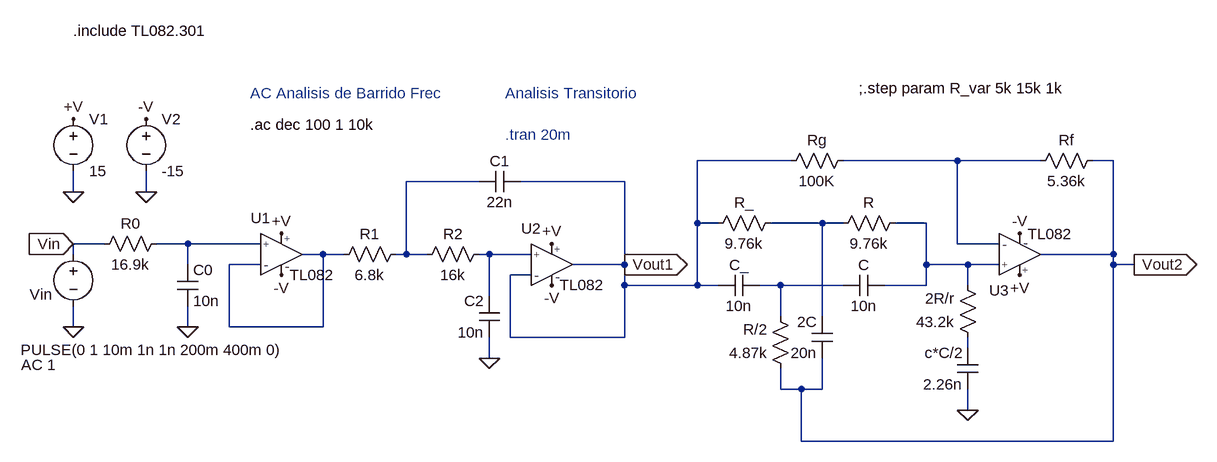
[diagram p0: schematic PasaBajos_Bessel_Fabricante_TL082_Eculizador_2doOrden_ValComerciales.asc]
PasaBajos_Bessel_Fabricante_TL082_Eculizador_2doOrden_ValComerciales.asc, the LTspice schematic file:
Version 4.1
SHEET 1 1584 680
WIRE 928 16 784 16
WIRE 1184 16 1008 16
WIRE 1312 16 1184 16
WIRE 1424 16 1392 16
WIRE 448 48 336 48
WIRE 672 48 512 48
WIRE -176 64 -176 32
WIRE -64 64 -64 32
WIRE 784 112 784 16
WIRE 816 112 784 112
WIRE 976 112 896 112
WIRE 1008 112 976 112
WIRE 1136 112 1088 112
WIRE -128 144 -176 144
WIRE 0 144 -48 144
WIRE 112 144 0 144
WIRE 1184 144 1184 16
WIRE 1248 144 1184 144
WIRE -176 160 -176 144
WIRE 208 160 176 160
WIRE 240 160 208 160
WIRE 336 160 336 48
WIRE 336 160 320 160
WIRE 368 160 336 160
WIRE 464 160 448 160
WIRE 528 160 464 160
WIRE 1424 160 1424 16
WIRE 1424 160 1312 160
WIRE 0 176 0 144
WIRE 112 176 64 176
WIRE 672 176 672 48
WIRE 672 176 592 176
WIRE 1136 176 1136 112
WIRE 1200 176 1136 176
WIRE 1248 176 1200 176
WIRE 1424 176 1424 160
WIRE 1456 176 1424 176
WIRE 528 192 496 192
WIRE 672 208 672 176
WIRE 784 208 784 112
WIRE 784 208 672 208
WIRE 816 208 784 208
WIRE 912 208 880 208
WIRE 1008 208 912 208
WIRE 1136 208 1136 176
WIRE 1136 208 1072 208
WIRE 1200 208 1200 176
WIRE 464 224 464 160
WIRE 912 256 912 208
WIRE 976 256 976 112
WIRE -176 272 -176 240
WIRE 0 272 0 240
WIRE 64 272 64 176
WIRE 208 272 208 160
WIRE 208 272 64 272
WIRE 496 288 496 192
WIRE 672 288 672 208
WIRE 672 288 496 288
WIRE 1200 304 1200 288
WIRE 464 320 464 288
WIRE 912 368 912 336
WIRE 944 368 912 368
WIRE 976 368 976 320
WIRE 976 368 944 368
WIRE 1200 400 1200 368
WIRE 944 448 944 368
WIRE 1424 448 1424 176
WIRE 1424 448 944 448
FLAG -176 64 0
FLAG -64 64 0
FLAG -176 -48 +V
FLAG 144 128 +V
FLAG 560 144 +V
FLAG -64 -48 -V
FLAG 144 192 -V
FLAG 560 208 -V
FLAG 0 272 0
FLAG 464 320 0
FLAG 672 176 Vout1
IOPIN 672 176 Out
FLAG -176 272 0
FLAG -176 144 Vin
IOPIN -176 144 In
FLAG 1280 192 +V
FLAG 1280 128 -V
FLAG 1200 400 0
FLAG 1456 176 Vout2
IOPIN 1456 176 Out
SYMBOL voltage -176 -64 R0
WINDOW 123 0 0 Left 0
WINDOW 39 0 0 Left 0
SYMATTR InstName V1
SYMATTR Value 15
SYMBOL voltage -64 -64 R0
WINDOW 123 0 0 Left 0
WINDOW 39 0 0 Left 0
SYMATTR InstName V2
SYMATTR Value -15
SYMBOL res -32 128 R90
WINDOW 0 0 56 VBottom 2
WINDOW 3 32 56 VTop 2
SYMATTR InstName R0
SYMATTR Value 16.9k
SYMBOL cap -16 176 R0
SYMATTR InstName C0
SYMATTR Value 10n
SYMBOL res 336 144 R90
WINDOW 0 0 56 VBottom 2
WINDOW 3 32 56 VTop 2
SYMATTR InstName R1
SYMATTR Value 6.8k
SYMBOL res 464 144 R90
WINDOW 0 0 56 VBottom 2
WINDOW 3 32 56 VTop 2
SYMATTR InstName R2
SYMATTR Value 16k
SYMBOL cap 512 32 R90
WINDOW 0 0 32 VBottom 2
WINDOW 3 32 32 VTop 2
SYMATTR InstName C1
SYMATTR Value 22n
SYMBOL cap 480 288 R180
WINDOW 0 24 56 Left 2
WINDOW 3 24 8 Left 2
SYMATTR InstName C2
SYMATTR Value 10n
SYMBOL voltage -176 144 R0
WINDOW 3 -81 163 Left 2
WINDOW 123 -80 186 Left 2
WINDOW 39 0 0 Left 0
WINDOW 0 -67 78 Left 2
SYMATTR Value PULSE(0 1 10m 1n 1n 200m 400m 0)
SYMATTR Value2 AC 1
SYMATTR InstName Vin
SYMBOL TL082 80 208 R0
SYMATTR InstName U1
SYMBOL TL082 496 224 R0
SYMATTR InstName U2
SYMBOL TL082 1216 112 M180
SYMATTR InstName U3
SYMBOL res 1024 0 R90
WINDOW 0 0 56 VBottom 2
WINDOW 3 32 56 VTop 2
SYMATTR InstName Rg
SYMATTR Value 100K
SYMBOL res 912 96 R90
WINDOW 0 0 56 VBottom 2
WINDOW 3 32 56 VTop 2
SYMATTR InstName R_
SYMATTR Value 9.76k
SYMBOL cap 880 192 R90
WINDOW 0 0 32 VBottom 2
WINDOW 3 32 32 VTop 2
SYMATTR InstName C_
SYMATTR Value 10n
SYMBOL res 1296 32 R270
WINDOW 0 32 56 VTop 2
WINDOW 3 0 56 VBottom 2
SYMATTR InstName Rf
SYMATTR Value 5.36k
SYMBOL res 1104 96 R90
WINDOW 0 0 56 VBottom 2
WINDOW 3 32 56 VTop 2
SYMATTR InstName R
SYMATTR Value 9.76k
SYMBOL cap 1072 192 R90
WINDOW 0 0 32 VBottom 2
WINDOW 3 32 32 VTop 2
SYMATTR InstName C
SYMATTR Value 10n
SYMBOL res 1216 304 R180
WINDOW 0 36 76 Left 2
WINDOW 3 36 40 Left 2
SYMATTR InstName 2R/r
SYMATTR Value 43.2k
SYMBOL cap 992 320 R180
WINDOW 0 24 56 Left 2
WINDOW 3 24 8 Left 2
SYMATTR InstName 2C
SYMATTR Value 20n
SYMBOL res 928 352 R180
WINDOW 0 36 76 Left 2
WINDOW 3 36 40 Left 2
SYMATTR InstName R/2
SYMATTR Value 4.87k
SYMBOL cap 1216 368 R180
WINDOW 0 24 56 Left 2
WINDOW 3 24 8 Left 2
SYMATTR InstName c*C/2
SYMATTR Value 2.26n
TEXT 96 -40 Left 2 !.ac dec 100 1 10k
TEXT 96 -88 Left 2 ;AC Analisis de Barrido Frec
TEXT 488 -88 Left 2 ;Analisis Transitorio
TEXT 488 -24 Left 2 ;.tran 20m
TEXT -176 -184 Left 2 !.include TL082.301
TEXT 1032 -96 Left 2 !;.step param R_var 5k 15k 1k

The netlist it stands for:
* PasaBajos_Bessel_Fabricante_TL082_Eculizador_2doOrden_ValComerciales.asc
V1 +V 0 15
V2 -V 0 -15
R0 N005 Vin 16.9k
C0 N005 0 10n
R1 N002 N006 6.8k
R2 N007 N002 16k
C1 Vout1 N002 22n
C2 0 N007 10n
Vin Vin 0 PULSE(0 1 10m 1n 1n 200m 400m 0) AC 1
X§U1 N005 N006 +V -V N006 TL082  ; pins 1 2 3 4 5
X§U2 N007 Vout1 +V -V Vout1 TL082  ; pins 1 2 3 4 5
X§U3 N004 N001 +V -V Vout2 TL082  ; pins 1 2 3 4 5
Rg N001 Vout1 100K
R_ N003 Vout1 9.76k
C_ N008 Vout1 10n
Rf N001 Vout2 5.36k
R N004 N003 9.76k
C N004 N008 10n
R§2R/r N009 N004 43.2k
C§2C Vout2 N003 20n
R/2 Vout2 N008 4.87k
c*C/2 0 N009 2.26n
.ac dec 100 1 10k
* AC Analisis de Barrido Frec
* Analisis Transitorio
* .tran 20m
.include TL082.301
;.step param R_var 5k 15k 1k
.lib TL082.301
.backanno
.end